# Altium project Raun_Programmer_Board.PrjPcb
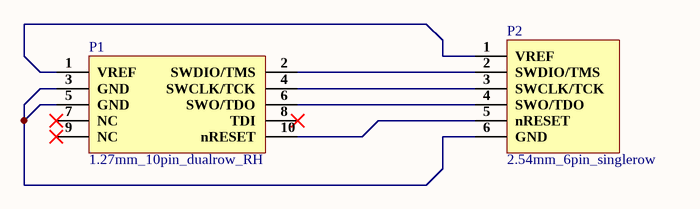
[diagram p0: Sheet1.SchDoc]
1 sheet, 2 parts. Net scope: global (net labels, ports and power ports of the same name join across sheets).
Board file: PCB1.PcbDoc

## Sheet Sheet1.SchDoc
size A4; SheetNumber: 1; SheetTotal: 1

### Parts
P1  1.27mm_10pin_dualrow_RH  [1.27mm_10pin_dualrow_RH]
P2  2.54mm_6pin_singlerow  [2.54mm_6pin_singlerow]

### Nets
NetP1_1: P1.1(VREF) P2.1(VREF)
NetP1_2: P1.2(SWDIO/TMS) P2.2(SWDIO/TMS)
NetP1_3: P1.3(GND) P1.5(GND) P2.6(GND)
NetP1_4: P1.4(SWCLK/TCK) P2.3(SWCLK/TCK)
NetP1_6: P1.6(SWO/TDO) P2.4(SWO/TDO)
NetP1_10: P1.10(nRESET) P2.5(nRESET)

Not connected (* = marked no-connect by the designer): P1 7(NC)* 8(TDI)* 9(NC)*

### Library data of the parts
P1 = 1.27mm_10pin_dualrow_RH: JTAG/SWD